# Altium schematic sheet USB_OTG_FS.SchDoc
size A3
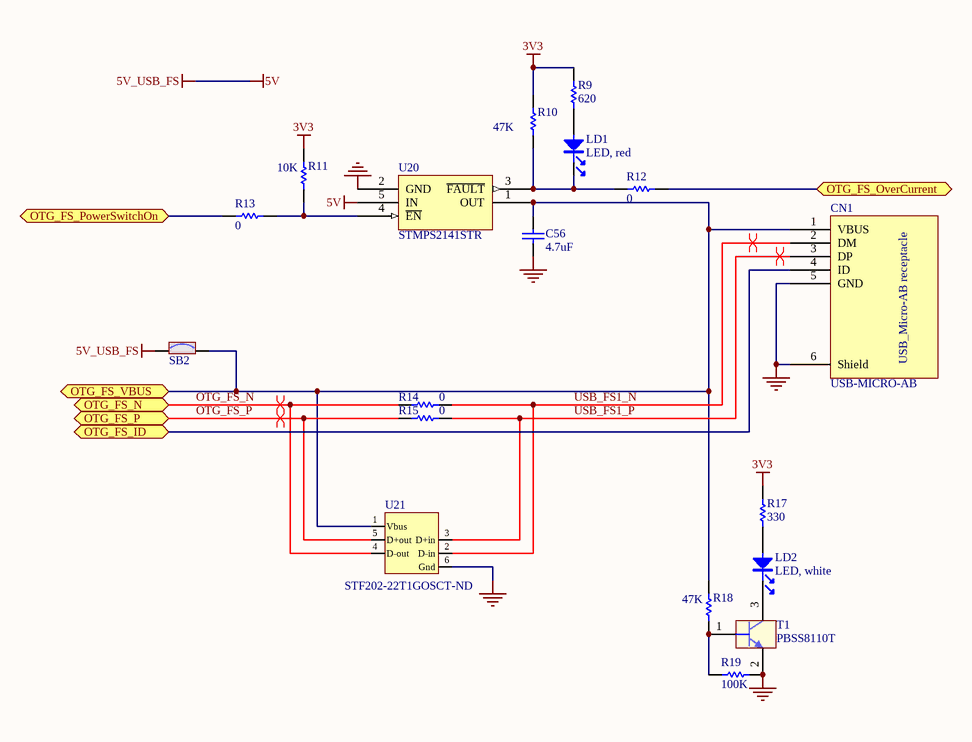
[diagram p0: USB_OTG_FS.SchDoc]

## Parts
C56  4.7uF  [0603]
CN1  USB-MICRO-AB  [USB-MICRO-AB, 47590-0001, SMT, MOLEX]
LD1  LED, red  [0603]
LD2  LED, white  [0603]
R9  620  [0603]
R10  47K  [0603]
R11  10K  [0603]
R12  0  [0603]
R13  0  [0603]
R14  0  [0603]
R15  0  [0603]
R17  330  [0603]
R18  47K  [0603]
R19  100K  [0603]
SB2  Solder Bridge ON  [0603]  (value not drawn)
T1  PBSS8110T  [CMBT 9013]
U20  STMPS2141STR  [STMPS2141STR]
U21  STF202-22T1GOSCT-ND  [SOT-457]

## Ports
OTG_FS_ID, OTG_FS_N, OTG_FS_OverCurrent, OTG_FS_P, OTG_FS_PowerSwitchOn, OTG_FS_VBUS

## Nets
3V3: R9.2 R10.2 R11.2 R17.2
5V: SB2.1 U20.5(IN)  [also labelled 5V_USB_FS]
GND: C56.2 CN1.5(GND) CN1.6(Shield) R19.2 T1.2(E) U20.2(GND) U21.6(Gnd)
OTG_FS_ID: CN1.4(ID) ; port OTG_FS_ID
OTG_FS_N: R14.1 U21.4(D-out) ; port OTG_FS_N
OTG_FS_OverCurrent: R12.2 ; port OTG_FS_OverCurrent
OTG_FS_P: R15.1 U21.5(D+out) ; port OTG_FS_P
OTG_FS_PowerSwitchOn: R13.1 ; port OTG_FS_PowerSwitchOn
OTG_FS_VBUS: C56.1 CN1.1(VBUS) R18.2 SB2.2 U20.1(OUT) U21.1(Vbus) ; port OTG_FS_VBUS
USB_FS1_N: CN1.2(DM) R14.2 U21.2(D-in)
USB_FS1_P: CN1.3(DP) R15.2 U21.3(D+in)
NetLD1_1: LD1.1 R9.1
NetLD1_2: LD1.2 R10.1 R12.1 U20.3(~{FAULT})
NetLD2_1: LD2.1 R17.1
NetLD2_2: LD2.2 T1.3(C)
NetR11_1: R11.1 R13.2 U20.4(~{EN})
NetR18_1: R18.1 R19.1 T1.1(B)

## Layout directives
differential pair: OTG_FS_N, OTG_FS_P, USB_FS1_N, USB_FS1_P

## Notes on the sheet
- (in symbol USB-MICRO-AB) USB_Micro-AB receptacle

## Library data of the parts
C56 = Cap_4.7uF_X5R_10%_0603: 0201; Manuf_Part_1: CC0603KRX5R7BB475; Manuf_1: YAGEO; Value: 10uF; Order: CC0603KRX5R7BB105; Revision: July-2002: Re-released for DXP Platform.; ECCN_US/EU: n/a
CN1 = USB-MICRO-AB: USB-MICRO-AB, 47590-0001, SMT, MOLEX; Ref St: xxxxxxx; Manuf_1: MOLEX; Manuf_Part_1: 47590-0001; ECCN_US/EU: n/a; Distrib: *
LD1 = LED_red: LED, red, 0603; Manuf_1: everlight; Manuf_Part_1: 19-213-R6C-AP1Q2B/3T; ECCN_US/EU: EAR99/NEC; Order: 19-213-R6C-AP1Q2B/3T
LD2 = LED_green: LED, green, 0603; Manuf_1: everlight; Manuf_Part_1: 19-213SYGC/S530-E2/TR8; ECCN_US/EU: EAR99/NEC; Order: 19-213SYGC/S530-E2/TR8
R9 = Res_620_1%_0603: 0201; Manuf_Part_1: CRCW0603620RFKEA; Manuf_1: VISHAY DRALORIC; Order: 2122341; Value: 620; ECCN_US/EU: n/a; Distrib: FARNELL
R10 R18 = Res_47K_1%_0402: 0201; Manuf_Part_1: RC0402FR-0747KL; Manuf_1: YAGEO; Order: 9239430; Value: 47K; ECCN_US/EU: n/a; Distrib: FARNELL
R11 = Res_10K_1%_0402: 0201; Manuf_Part_1: RC0402FR-0710KL; Manuf_1: YAGEO; Value: 10K; Order: RC0402FR-0710KL; ECCN_US/EU: n/a
R12-R15 = Res_0_5%_0402: 0201; Manuf_Part_1: RC0402JR-070RL; Manuf_1: YAGEO; Order: 2363467; Value: 0; ECCN_US/EU: n/a; Distrib: FARNELL
R17 = Res_330_1%_0603: 0201; Manuf_Part_1: RT0603FRE07330RL; Manuf_1: YAGEO; Order: 1500622RL; Value: 330; ECCN_US/EU: n/a; Distrib: FARNELL
R19 = Res_100K_1%_0402: 0201; Manuf_Part_1: RT0402FRE07100KL; Manuf_1: YAGEO; Value: 100K; Order: RT0402FRE07100KL; ECCN_US/EU: n/a
SB2 = SB_ON: Solder: YES; Revision: July-2002: Re-released for DXP Platform.; ECCN_US/EU: n/a
T1 = 9013-SOT23: NPN Bipolar Transistor; Manuf_1: NXP; Manuf_Part_1: BSR14; Order: 1081310; ECCN_US/EU: EAR99/NEC; Revision: July-2002: Re-released for DXP Platform.; Distrib: FARNELL
U20 = STMPS2141STR: Enhanced single channel power switches; Manuf_1: STM; Provided: ST; ECCN_US/EU: EAR99/NEC; Ref St: 9159003; Order: STMPS2141STR; Manuf_Part_1: STMPS2141STR; Distrib: ST